# Altium schematic sheet Interface_Sheet.SchDoc
size A4; DocumentNumber: 14; SheetNumber: 14; SheetTotal: 27
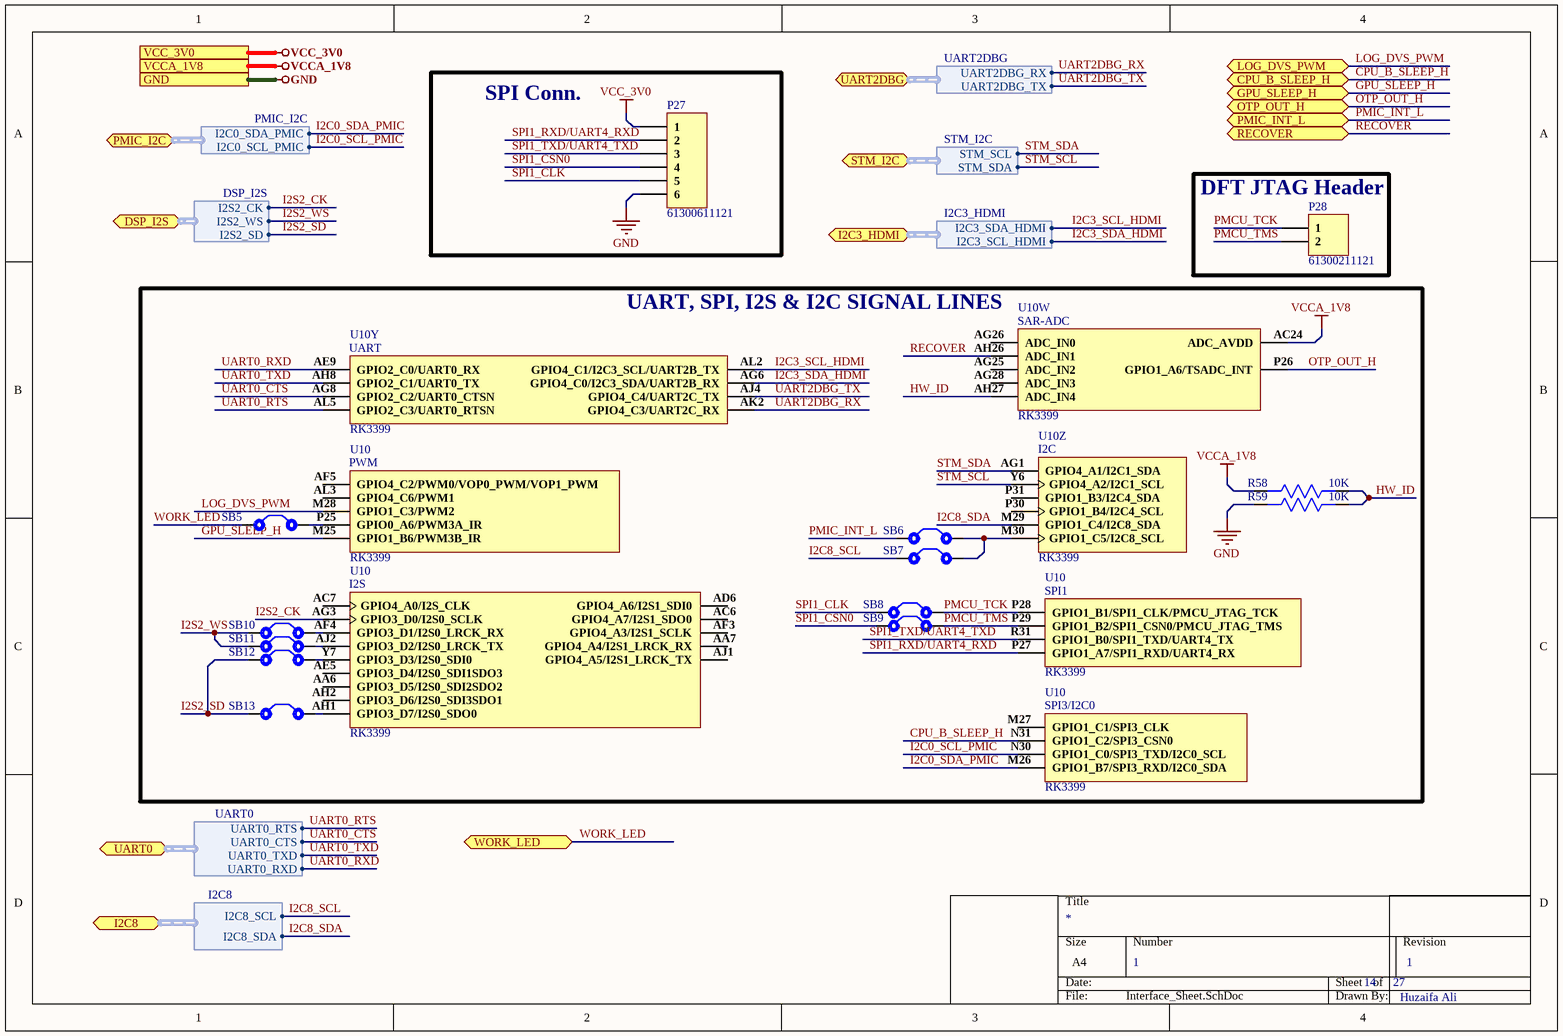
[diagram p0: Interface_Sheet.SchDoc]

## Parts
P27  61300611121  [HDR1X6]
P28  61300211121  [HDR1X2]
R58  10K  [Res0603]
R59  10K  [Res0603]
SB5  Solder Bridge  [Solder Bridge]  (value not drawn)
SB6  Solder Bridge  [Solder Bridge]  (value not drawn)
SB7  Solder Bridge  [Solder Bridge]  (value not drawn)
SB8  Solder Bridge  [Solder Bridge]  (value not drawn)
SB9  Solder Bridge  [Solder Bridge]  (value not drawn)
SB10  Solder Bridge  [Solder Bridge]  (value not drawn)
SB11  Solder Bridge  [Solder Bridge]  (value not drawn)
SB12  Solder Bridge  [Solder Bridge]  (value not drawn)
SB13  Solder Bridge  [Solder Bridge]  (value not drawn)
U10  RK3399  [RK3399]  (parts W,Y,Z,27,30,31,32 of 34)

## Blocks framed on the sheet
SPI Conn.: P27
DFT JTAG Header: P28
UART, SPI, I2S & I2C SIGNAL LINES: R58 R59 SB5-SB13 U10

## Ports
CPU_B_SLEEP_H (bidir), DSP_I2S (bidir, harness DSP_I2S), GND, GPU_SLEEP_H (bidir), I2C3_HDMI (bidir, harness I2C3_HDMI), I2C8 (bidir, harness I2C8), LOG_DVS_PWM (bidir), OTP_OUT_H (bidir), PMIC_I2C (bidir, harness PMIC_I2C), PMIC_INT_L (bidir), RECOVER (bidir), STM_I2C (bidir, harness STM_I2C), UART0 (bidir, harness UART0), UART2DBG (bidir, harness UART2DBG), VCC_3V0, VCCA_1V8, WORK_LED (bidir)

## Harnesses
PMIC_I2C: I2C0_SDA_PMIC, I2C0_SCL_PMIC
DSP_I2S: I2S2_CK, I2S2_WS, I2S2_SD
I2C3_HDMI: I2C3_SCL_HDMI, I2C3_SDA_HDMI
UART2DBG: UART2DBG_TX, UART2DBG_RX
UART0: UART0_RXD, UART0_TXD, UART0_CTS, UART0_RTS
I2C8: I2C8_SDA, I2C8_SCL
STM_I2C: STM_SDA, STM_SCL

## Nets
GND: P27.6 R59.2 ; port GND
VCC_3V0: P27.1 ; port VCC_3V0
VCCA_1V8: R58.2 U10.AC24(ADC_AVDD) ; port VCCA_1V8
CPU_B_SLEEP_H: U10.N31(GPIO1_C2/SPI3_CSN0) ; port CPU_B_SLEEP_H
GPU_SLEEP_H: U10.M25(GPIO1_B6/PWM3B_IR) ; port GPU_SLEEP_H
HW_ID: R58.1 R59.1 U10.AH27(ADC_IN4)
I2C0_SCL_PMIC: U10.N30(GPIO1_C0/SPI3_TXD/I2C0_SCL) ; port PMIC_I2C.I2C0_SCL_PMIC
I2C0_SDA_PMIC: U10.M26(GPIO1_B7/SPI3_RXD/I2C0_SDA) ; port PMIC_I2C.I2C0_SDA_PMIC
I2C3_SCL_HDMI: U10.AL2(GPIO4_C1/I2C3_SCL/UART2B_TX) ; port I2C3_HDMI.I2C3_SDA_HDMI
I2C3_SDA_HDMI: U10.AG6(GPIO4_C0/I2C3_SDA/UART2B_RX) ; port I2C3_HDMI.I2C3_SCL_HDMI
I2C8_SCL: SB7.1 ; port I2C8.I2C8_SCL
I2C8_SDA: U10.M29(GPIO1_C4/I2C8_SDA) ; port I2C8.I2C8_SDA
I2S2_CK: U10.AG3(GPIO3_D0/I2S0_SCLK) ; port DSP_I2S.I2S2_CK
I2S2_SD: SB12.1 SB13.1 ; port DSP_I2S.I2S2_SD
I2S2_WS: SB10.1 SB11.1 ; port DSP_I2S.I2S2_WS
LOG_DVS_PWM: U10.M28(GPIO1_C3/PWM2) ; port LOG_DVS_PWM
OTP_OUT_H: U10.P26(GPIO1_A6/TSADC_INT) ; port OTP_OUT_H
PMCU_TCK: P28.1 SB8.2 U10.P28(GPIO1_B1/SPI1_CLK/PMCU_JTAG_TCK)
PMCU_TMS: P28.2 SB9.2 U10.P29(GPIO1_B2/SPI1_CSN0/PMCU_JTAG_TMS)
PMIC_INT_L: SB6.1 ; port PMIC_INT_L
RECOVER: U10.AH26(ADC_IN1) ; port RECOVER
SPI1_CLK: P27.5 SB8.1
SPI1_CSN0: P27.4 SB9.1
SPI1_RXD/UART4_RXD: P27.2 U10.P27(GPIO1_A7/SPI1_RXD/UART4_RX)
SPI1_TXD/UART4_TXD: P27.3 U10.R31(GPIO1_B0/SPI1_TXD/UART4_TX)
STM_SCL: U10.Y6(GPIO4_A2/I2C1_SCL) ; port STM_I2C.STM_SDA
STM_SDA: U10.AG1(GPIO4_A1/I2C1_SDA) ; port STM_I2C.STM_SCL
UART0_CTS: U10.AG8(GPIO2_C2/UART0_CTSN) ; port UART0.UART0_CTS
UART0_RTS: U10.AL5(GPIO2_C3/UART0_RTSN) ; port UART0.UART0_RTS
UART0_RXD: U10.AE9(GPIO2_C0/UART0_RX) ; port UART0.UART0_RXD
UART0_TXD: U10.AH8(GPIO2_C1/UART0_TX) ; port UART0.UART0_TXD
UART2DBG_RX: U10.AK2(GPIO4_C3/UART2C_RX) ; port UART2DBG.UART2DBG_RX
UART2DBG_TX: U10.AJ4(GPIO4_C4/UART2C_TX) ; port UART2DBG.UART2DBG_TX
WORK_LED: SB5.1 ; port WORK_LED
NetSB5_2: SB5.2 U10.P25(GPIO0_A6/PWM3A_IR)
NetSB6_2: SB6.2 SB7.2 U10.M30(GPIO1_C5/I2C8_SCL)
NetSB10_2: SB10.2 U10.AF4(GPIO3_D1/I2S0_LRCK_RX)
NetSB11_2: SB11.2 U10.AJ2(GPIO3_D2/I2S0_LRCK_TX)
NetSB12_2: SB12.2 U10.Y7(GPIO3_D3/I2S0_SDI0)
NetSB13_2: SB13.2 U10.AH1(GPIO3_D7/I2S0_SDO0)

Not connected (* = marked no-connect by the designer): U10 AA6(GPIO3_D5/I2S0_SDI2SDO2) AA7(GPIO4_A4/I2S1_LRCK_RX) AC6(GPIO4_A7/I2S1_SDO0) AC7(GPIO4_A0/I2S_CLK) AD6(GPIO4_A6/I2S1_SDI0) AE5(GPIO3_D4/I2S0_SDI1SDO3) AF3(GPIO4_A3/I2S1_SCLK) AF5(GPIO4_C2/PWM0/VOP0_PWM/VOP1_PWM) AG25(ADC_IN2) AG26(ADC_IN0) AG28(ADC_IN3) AH2(GPIO3_D6/I2S0_SDI3SDO1) AJ1(GPIO4_A5/I2S1_LRCK_TX) AL3(GPIO4_C6/PWM1) M27(GPIO1_C1/SPI3_CLK) P30(GPIO1_B4/I2C4_SCL) P31(GPIO1_B3/I2C4_SDA)

## Notes on the sheet
- 1
- Huzaifa Ali
- (in symbol RK3399, part W) SAR-ADC
- (in symbol RK3399, part Y) UART
- (in symbol RK3399, part Z) I2C
- (in symbol RK3399, part 27) PWM
- (in symbol RK3399, part 30) SPI1
- (in symbol RK3399, part 31) SPI3/I2C0
- (in symbol RK3399, part 32) I2S

## Library data of the parts
P27 = 61300611121: CONN HEADER 6 POS 2.54; Manufacturer: Wurth Electronics; Current Rating: 3A; Voltage Rating: 250V; Number of Positions: 6; Gender: Male; Connector Type: Male Pin; Pitch: 0.1inch; Supplier 1: Newark; Manufacturer Part Number: 61300611121; RoHS: Yes; Category: Headers and Wire Housings; Stock 1: 4996; Pricing 1: 1=0.34000, 10=0.28900, 25=0.24000, 50=0.20100, 100=0.18200 (USD); Mount: Through Hole; Contact Plating: Gold; Contact Material: Copper Alloy,Copper; Housing Material: PBT; Color: Black; Min Operating Temperature: -40°C; Max Operating Temperature: 125°C; Number of Rows: 1; Contact Gender: Male; Packaging: Bulk; Termination: Through Hole; Number of Contacts: 6; Series: WR-PHD; Contact Type: Male Pin; Contact Mating Length: 0.236inch; REACH SVHC: Unknown; Lead Free: Lead Free; RoHS Compliant: Yes; ComponentLink1URL: http://www.mouser.com/ds/2/445/6130xx11121-538006.pdf?src-supplier=Mouser; ComponentLink1Description: http://www.mouser.com/ds/2/445/6130xx11121-538006.pdf?src-supplier=Mouser; ComponentLink2URL: http://www.farnell.com/cad/1737268.pdf?src-supplier=Element14; ComponentLink2Description: http://www.farnell.com/cad/1737268.pdf?src-supplier=Element14; ComponentLink3URL: https://katalog.we-online.de/em/datasheet/6130xx11121.pdf?src-supplier=Digi-Key; ComponentLink3Description: https://katalog.we-online.de/em/datasheet/6130xx11121.pdf?src-supplier=Digi-Key; Supplier Part Number 1: 20X0957
P28 = 61300211121: CONN HEADER VERT 2POS 2.54MM; Manufacturer: Wurth Electronics; Current Rating: 3A; Voltage Rating: 250V; Number of Positions: 2; Gender: Male; Connector Type: Male Pin; Pitch: 0.1inch; Supplier 1: Digi-Key; Manufacturer Part Number: 61300211121; Stock 1: 219205; Pricing 1: 1=0.13, 10=0.106, 25=0.088, 50=0.074, 100=0.067, 1000=0.061 (USD); Mount: Through Hole; Contact Plating: Gold; Housing Material: PBT; Contact Material: Copper Alloy,Copper; Color: Black; Min Operating Temperature: -40°C; Max Operating Temperature: 125°C; Number of Rows: 1; Contact Gender: Male; Packaging: Bulk; Termination: Through Hole; Number of Contacts: 2; Contact Mating Length: 0.236inch; REACH SVHC: Unknown; Lead Free: Lead Free; ComponentLink1URL: http://www.mouser.com/ds/2/445/6130xx11121-538006.pdf?src-supplier=Mouser; ComponentLink1Description: http://www.mouser.com/ds/2/445/6130xx11121-538006.pdf?src-supplier=Mouser; Supplier Part Number 1: 732-5315-ND
R58 R59 = AC0603JR-0710KL: RES SMD 10K OHM 5% 1/10W 0603; Manufacturer: Yageo; Voltage Rating: 50V; Resistance: 10kR; Power Rating: 100mW; Temperature Coefficient: 100ppm/°C; Supplier 1: Future Electronics; Manufacturer Part Number: AC0603JR-0710KL; RoHS: Yes; Category: Chip SMD Resistors; Stock 1: 1533000; Pricing 1: 5000=0.00540 (USD); Case/Package: 0603; Case Code (Imperial): 0603; Case Code (Metric): 1608; Size Code: 0603; Min Operating Temperature: -55°C; Max Operating Temperature: 155°C; Packaging: Tape and Reel; Tolerance: 5%; Package Quantity: 1; Resistor Type: Thick Film; Termination: SMD/SMT; Number of Terminations: 2; Max Power Dissipation: 100mW; Features: Moisture Resistant,Automotive AEC-Q200,Anti-Sulfur; Series: AC; Construction: Rectangular; Length: 0.063inch; Width: 0.031inch; Height: 0.022inch; Depth: 0.8mm; Military Standard: Not; Lead Free: Lead Free; RoHS Compliant: Yes; ComponentLink1URL: https://datasheet.ciiva.com/5562/pyu-ac-51-rohs-l-2-5562553.pdf?src-supplier=Mouser; ComponentLink1Description: https://datasheet.ciiva.com/5562/pyu-ac-51-rohs-l-2-5562553.pdf?src-supplier=Mouser; Supplier Part Number 1: 1029044
SB5-SB13 = Solder Bridge: Solder Bridge ON
U10 = RK3399: RK3399 CPU BGA for HD set-top box chip BGA Chipse; Manufacturer: Fuzhou Rockchip Electronics; ComponentLink1Description: Aliexpress; ComponentLink1URL: https://www.aliexpress.com/item/1005001971093459.html?spm=a2g0n.productlist.0.0.3c7csv8Qsv8Quh&browser_id=3ac7e9efb8074641aaabc4d871f09748&aff_trace_key=&aff_platform=msite&m_page_id=181389a08711fc2600d8cc522bab8d702dd4189be0&gclid=&pdp_npi=2%40dis%21USD%21%2123.6%21%21%21%21%21%402101d91e16545120399167831e8b89%21%21sea&algo_pvid=4303aedd-774c-4013-953d-920f10b55003; Manufacturer Part Number: RK3399; Footprint: FCBGA828